# Altium schematic sheet Regulator.SchDoc
size A; SheetNumber: 9; SheetTotal: 9
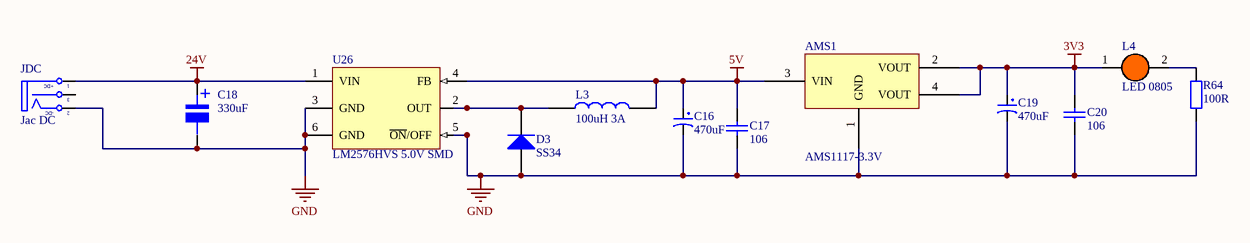
[diagram p0: Regulator.SchDoc]

## Parts
AMS1  AMS1117-3.3V  [SOT223]
C16  470uF  [tu hoa 8mm]
C17  106  [tu 0805]
C18  330uF  [tu nhom 10 (g)]
C19  470uF  [tu hoa 8mm]
C20  106  [tu 0805]
D3  SS34  [DIODE SMA]
JDC  Jac DC  [DC-IN]
L3  100uH 3A  [CUON CAM 100uH3A]
L4  LED 0805  [LED-0805-Orange]
R64  100R  [tro smd 0805]
U26  LM2576HVS 5.0V SMD  [TO263-5]

## Nets
3V3: AMS1.2(VOUT) AMS1.4(VOUT) C19.1 C20.2 L4.1(A)
5V: AMS1.3(VIN) C16.1 C17.2 L3.2 U26.4(FB)
24V: C18.1 JDC.1(T) U26.1(VIN)
GND: AMS1.1(GND) C16.2 C17.1 C18.2 C19.2 C20.1 D3.1(A) JDC.2(TN) R64.2 U26.3(GND) U26.5(~{ON}/OFF) U26.6(GND)
NetD3_2: D3.2(K) L3.1 U26.2(OUT)
NetL4_2: L4.2(K) R64.1

Not connected (* = marked no-connect by the designer): JDC 3(S)

## Notes on the sheet
- (in symbol DCIN) +DC; -DC
- (in symbol Tu Nhom 330uF 35V) +

## Library data of the parts
AMS1 = AMS1117 SMD: Dán; Value: AMS1117-3.3V SOT223; Don_Vi: Con; Ma_Hang: MH000596; Ghi_Chu: *; Kieu_Chan: *; Chung_Loai: Dán
C16 C19 = Tu Hoa 470uF 16V 8x11: Cắm; Don_Vi: Con; So_Chan: 2; Ten_Linh_Kien: Tụ Hóa 470uF 16V 8x11MM; Ma_Hang: MH006550; Chung_Loai: Cắm; Kieu_Chan: *
C17 C20 = Tu 0805 106 16V 10%: Dán; Ten_Linh_Kien: Tụ 0805 106-10uF 10% 16V; So_Chan: 2; Don_Vi: Con; Ma_Hang: MH004553; Chung_Loai: Dán; Kieu_Chan: *
C18 = Tu Nhom 330uF 35V: Dán; Don_Vi: Con; So_Chan: 2; Ten_Linh_Kien: Tụ Nhôm 330uF 35V 10x10.5MM; Ma_Hang: MH004414; Chung_Loai: Dán; Kieu_Chan: *
D3 = Diode SS34 ( 1N5822 ): Dán; Don_Vi: Con; Ma_Hang: MH002104; Ten_Linh_Kien: Diode SS34 3A 40V SMA ( 1N5822 SS34A); Kieu_Chan: *; Chung_Loai: Dán
JDC = DCIN: Jac DC input; Value: Jac DC
L3 = CUON CAM 100uH DIP: Dán; Don_Vi: Con; Ma_Hang: MH002209; Ten_Linh_Kien: Cuộn Cảm 100uH 3A 8x10MM; Chung_Loai: Dán; Ghi Chu: *; Kieu Chan: *
L4 = LED 0805 Cam: Dán; Don_Vi: Con; Ma_Hang: MH002328; Ten_Linh_Kien: LED 0805 Màu Cam ( Orange); Ghi_Chu: *; Kieu_Chan: *; Chung_Loai: Dán
R64 = Tro 0805 5% 100R: Dán; Don_Vi: Con; So_Chan: 2; Ten_Linh_Kien: Trở 0805 5% 100R; Ma_Hang: MH005251; Chung_Loai: Dán; Kieu_Chan: *
U26 = LM2576HVS 5.0V SMD: Dán; Ten_Linh_Kien: LM2576HVS-5.0V BUCK 5V 3A TO263-5; Don_Vi: Con; Ma_Hang: MH002362; Ghi_Chu: *; Kieu_Chan: *; Chung_Loai: Dán